# Altium schematic sheet Page 1 - USB Interface.SchDoc
size A3
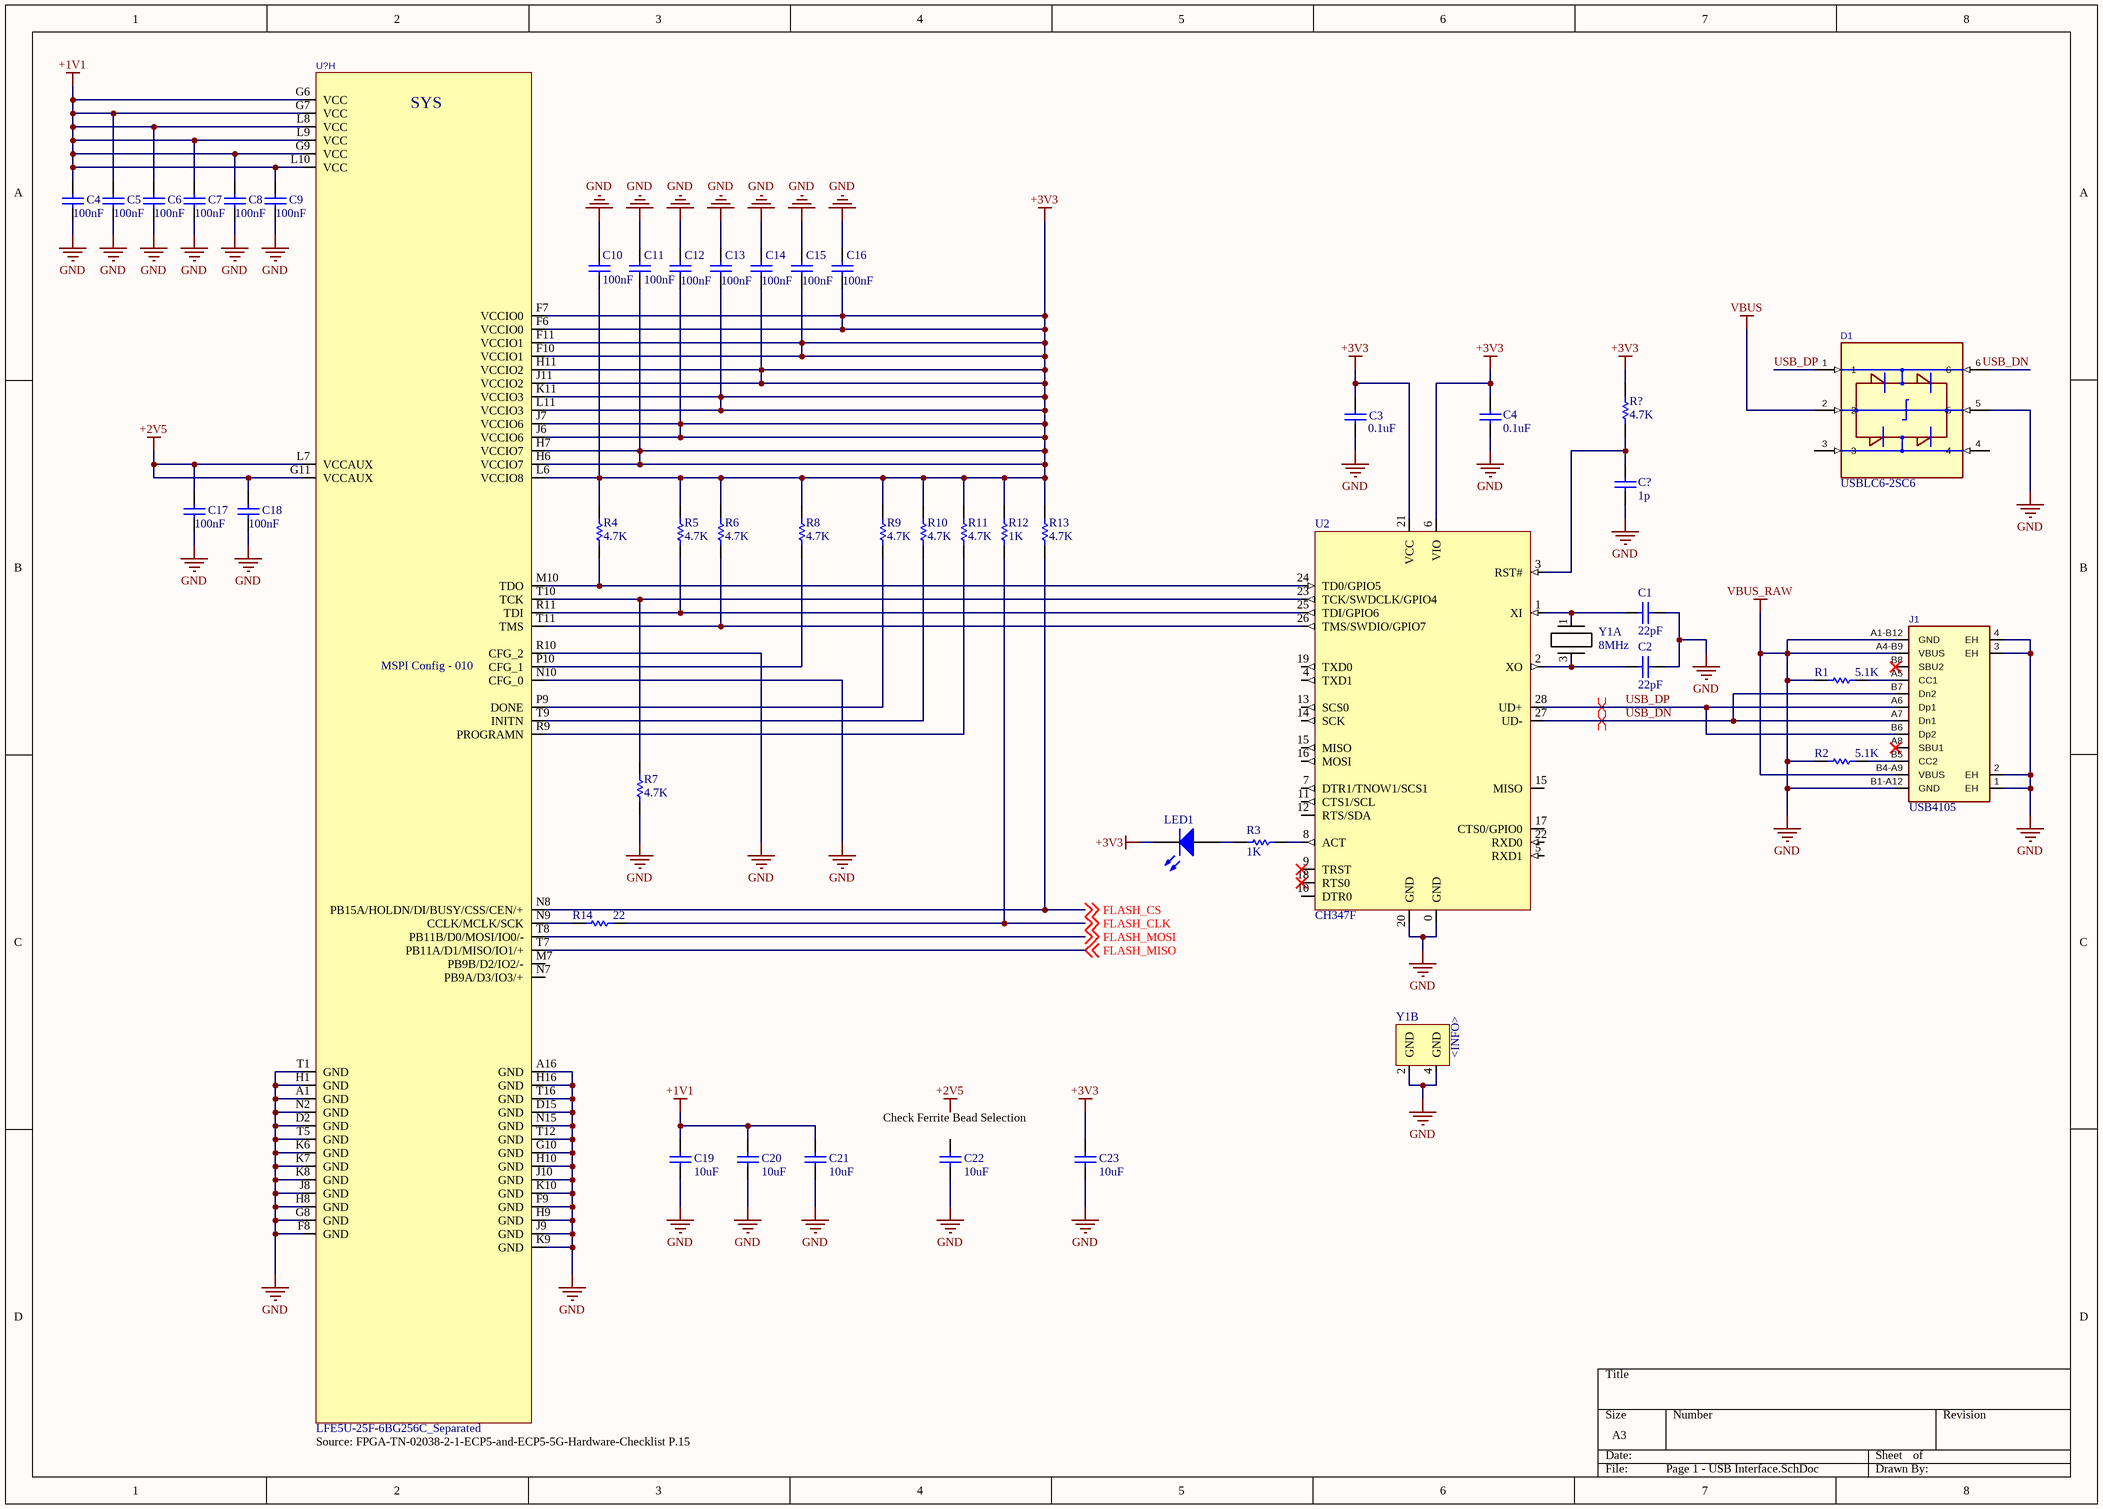
[diagram p0: Page 1 - USB Interface.SchDoc]

## Parts
(Parts that share a designator on the sheet are numbered #1, #2 ... from top to bottom, then left to right.)
C1  value 22pF  (hidden comment: Capacitor)
C2  value 22pF  (hidden comment: Capacitor)
C3  value 0.1uF  (hidden comment: Capacitor)
C4#1  value 100nF  (hidden comment: Capacitor)
C4#2  value 0.1uF  (hidden comment: Capacitor)
C5  value 100nF  (hidden comment: Capacitor)
C6  value 100nF  (hidden comment: Capacitor)
C7  value 100nF  (hidden comment: Capacitor)
C8  value 100nF  (hidden comment: Capacitor)
C9  value 100nF  (hidden comment: Capacitor)
C10  value 100nF  (hidden comment: Capacitor)
C11  value 100nF  (hidden comment: Capacitor)
C12  value 100nF  (hidden comment: Capacitor)
C13  value 100nF  (hidden comment: Capacitor)
C14  value 100nF  (hidden comment: Capacitor)
C15  value 100nF  (hidden comment: Capacitor)
C16  value 100nF  (hidden comment: Capacitor)
C17  value 100nF  (hidden comment: Capacitor)
C18  value 100nF  (hidden comment: Capacitor)
C19  value 10uF  (hidden comment: Capacitor)
C20  value 10uF  (hidden comment: Capacitor)
C21  value 10uF  (hidden comment: Capacitor)
C22  value 10uF  (hidden comment: Capacitor)
C23  value 10uF  (hidden comment: Capacitor)
C?  value 1p  (hidden comment: Capacitor)
D1  USBLC6-2SC6  [SOT-23-6_L2.9-W1.6-P0.95-LS2.8-BL]
J1  USB4105  [USB-C-SMD_MC-311D]
LED1  Light-Emitting Diode  (value not drawn)
R1  value 5.1K  (hidden comment: Resistor)
R2  value 5.1K  (hidden comment: Resistor)
R3  value 1K  (hidden comment: Resistor)
R4  value 4.7K  (hidden comment: Resistor)
R5  value 4.7K  (hidden comment: Resistor)
R6  value 4.7K  (hidden comment: Resistor)
R7  value 4.7K  (hidden comment: Resistor)
R8  value 4.7K  (hidden comment: Resistor)
R9  value 4.7K  (hidden comment: Resistor)
R10  value 4.7K  (hidden comment: Resistor)
R11  value 4.7K  (hidden comment: Resistor)
R12  value 1K  (hidden comment: Resistor)
R13  value 4.7K  (hidden comment: Resistor)
R14  value 22  (hidden comment: Resistor)
R?  value 4.7K  (hidden comment: Resistor)
U2  CH347F  [QFN40P400X400X80_HS-29N]
U?  LFE5U-25F-6BG256C_Separated  [CABGA-256_L14.0-W14.0-R16-C16-P0.80-TL]  (part H of 8)
Y1  8MHz  [X32258MSB4SI]  (parts A,B of 2)

## Nets
+1V1: C4#1.2 C5.2 C6.2 C7.2 C8.2 C9.2 C19.2 C20.2 C21.2 U?.G6(VCC) U?.G7(VCC) U?.G9(VCC) U?.L8(VCC) U?.L9(VCC) U?.L10(VCC)
+2V5: C17.2 C18.2 U?.G11(VCCAUX) U?.L7(VCCAUX)
+3V3: C3.2 C4#2.2 C10.1 C11.1 C12.1 C13.1 C14.1 C15.1 C16.1 C23.2 LED1.2(K) R4.2 R5.2 R6.2 R8.2 R9.2 R10.2 R11.2 R12.2 R13.2 R?.2 U2.6(VIO) U2.21(VCC) U?.F6(VCCIO0) U?.F7(VCCIO0) U?.F10(VCCIO1) U?.F11(VCCIO1) U?.H6(VCCIO7) U?.H7(VCCIO7) U?.H11(VCCIO2) U?.J6(VCCIO6) U?.J7(VCCIO6) U?.J11(VCCIO2) U?.K11(VCCIO3) U?.L6(VCCIO8) U?.L11(VCCIO3)
GND: C1.2 C2.2 C3.1 C4#1.1 C4#2.1 C5.1 C6.1 C7.1 C8.1 C9.1 C10.2 C11.2 C12.2 C13.2 C14.2 C15.2 C16.2 C17.1 C18.1 C19.1 C20.1 C21.1 C22.1 C23.1 C?.1 D1.5 J1.1(EH) J1.2(EH) J1.3(EH) J1.4(EH) J1.A1-B12(GND) J1.A4-B9(VBUS) J1.B1-A12(GND) J1.B4-A9(VBUS) R1.1 R2.1 R7.1 U2.0(GND) U2.20(GND) U?.A1(GND) U?.A16(GND) U?.D2(GND) U?.D15(GND) U?.F8(GND) U?.F9(GND) U?.G8(GND) U?.G10(GND) U?.H1(GND) U?.H8(GND) U?.H9(GND) U?.H10(GND) U?.H16(GND) U?.J8(GND) U?.J9(GND) U?.J10(GND) U?.K6(GND) U?.K7(GND) U?.K8(GND) U?.K9(GND) U?.K10(GND) U?.N2(GND) U?.N10(CFG_0) U?.N15(GND) U?.R10(CFG_2) U?.T1(GND) U?.T5(GND) U?.T12(GND) U?.T16(GND) Y1.2(GND) Y1.4(GND)  [also labelled VBUS_RAW]
VBUS: D1.2
FLASH_CLK: R12.1 R14.2 ; off-sheet FLASH_CLK
FLASH_CS: R13.1 U?.N8(PB15A/HOLDN/DI/BUSY/CSS/CEN/+) ; off-sheet FLASH_CS
FLASH_MISO: U?.T7(PB11A/D1/MISO/IO1/+) ; off-sheet FLASH_MISO
FLASH_MOSI: U?.T8(PB11B/D0/MOSI/IO0/-) ; off-sheet FLASH_MOSI
USB_DN: D1.6 J1.A7(Dn1) J1.B7(Dn2) U2.27(UD-)
USB_DP: D1.1 J1.A6(Dp1) J1.B6(Dp2) U2.28(UD+)
NetC1_1: C1.1 U2.1(XI) Y1.1
NetC2_1: C2.1 U2.2(XO) Y1.3
NetC?_2: C?.2 R?.1 U2.3(RST#)
NetJ1_A5: J1.A5(CC1) R1.2
NetJ1_B5: J1.B5(CC2) R2.2
NetLED1_1: LED1.1(A) R3.1
NetR3_2: R3.2 U2.8(ACT)
NetR4_1: R4.1 U2.24(TD0/GPIO5) U?.M10(TDO)
NetR5_1: R5.1 U2.25(TDI/GPIO6) U?.R11(TDI)
NetR6_1: R6.1 U2.26(TMS/SWDIO/GPIO7) U?.T11(TMS)
NetR7_2: R7.2 U2.23(TCK/SWDCLK/GPIO4) U?.T10(TCK)
NetR8_1: R8.1 U?.P10(CFG_1)
NetR9_1: R9.1 U?.P9(DONE)
NetR10_1: R10.1 U?.T9(INITN)
NetR11_1: R11.1 U?.R9(PROGRAMN)
NetR14_1: R14.1 U?.N9(CCLK/MCLK/SCK)

Not connected (* = marked no-connect by the designer): C22 2; D1 3 4; J1 A8(SBU1)* B8(SBU2)*; U2 4(TXD1) 5(RXD1) 7(DTR1/TNOW1/SCS1) 9(TRST)* 10(DTR0) 11(CTS1/SCL) 12(RTS/SDA) 13(SCS0) 14(SCK) 15(MISO) 16(MOSI) 17(CTS0/GPIO0) 18(RTS0)* 19(TXD0) 22(RXD0); U? M7(PB9B/D2/IO2/-) N7(PB9A/D3/IO3/+)

## Layout directives
differential pair: USB_DN, USB_DP

## Notes on the sheet
- (near U?) MSPI Config - 010
- Check Ferrite Bead Selection
- Source: FPGA-TN-02038-2-1-ECP5-and-ECP5-5G-Hardware-Checklist P.15
- Labels drawn without touching a wire or pin: +2V5
- (in symbol LFE5U-25F-6BG256C_Separated, part H) SYS

## Library data of the parts
C1-C3 C4#1 C4#2 C5-C23 C? = Capacitor: SimulationGenericComponent: True
D1 = USBLC6-2SC6: Manufacturer: ST(意法半导体); ki_keywords: ESD Protection Devices; Footprint: easyeda2kicad:SOT-23-6_L2.9-W1.6-P0.95-LS2.8-BL; Supplier: https://lcsc.com/product-detail/Diodes-ESD_STMicroelectronics_USBLC6-2SC6_USBLC6-2SC6_C7519.html; MPN: USBLC6-2SC6; LCSC Part: C7519; ki_description: USBLC6-2SC6; Value: USBLC6-2SC6
J1 = USB4105-GF-A-120: Manufacturer: GCT; Footprint: easyeda2kicad:USB-C-SMD_MC-311D; Supplier: https://www.lcsc.com/datasheet/C5184243.pdf; MPN: USB4105-GF-A-120; LCSC Part: C5184243; Value: USB4105-GF-A-120
LED1 = LED: AF: 1; BV: 0; BV_MAX: 1e99; EG: 1.11; FC: 0.5; IBV: 0.001; IS: 1e-14; MJSW: 0.33; NTUN: 30; TNOM: 27; XTI: 3; SimulationGenericComponent: True; CJO: 0; CJP: 0; CTA: 0; CTP: 0; FCS: 0.5; FV_MAX: 1e99; IKF: 0; IKR: 0; ISR: 1e-14; JSW: 0; JTUN: 0; JTUNSW: 0; KEG: 1; KF: 0; LEVEL: 1; N: 1; NBV: 1; NR: 1; NS: 1; PHP: 1; RS: 0; TCV: 0; TLEV: 0; TLEVC: 0; TM1: 0; TM2: 0; TPB: 0; TPHP: 0; TRS: 0; TRS2: 0; TT: 0; TTT1: 0; TTT2: 0; VJ: 1; XTITUN: 3
R1-R14 R? = Resistor: TC1: 0; SimulationGenericComponent: True; TC2: 0
U2 = CH347F: -40℃~+85℃ 180Ω 20pF 8MHz Crystal Oscillator ±10ppm ±20ppm SMD3225-4P Crystals ROHS
U? = LFE5U-25F-6BG256C_Separated: Manufacturer: LATTICE(莱迪思); ki_keywords: CPLD/FPGA; Footprint: easyeda2kicad:CABGA-256_L14.0-W14.0-R16-C16-P0.80-TL; Supplier: https://www.lcsc.com/datasheet/C1521614.pdf; MPN: LFE5U-25F-6BG256C; LCSC Part: C1521614
Y1 = Crystal